# EasyEDA Pro project 立创·天猛星MSPM0G3507开发板.eprj, board PCB
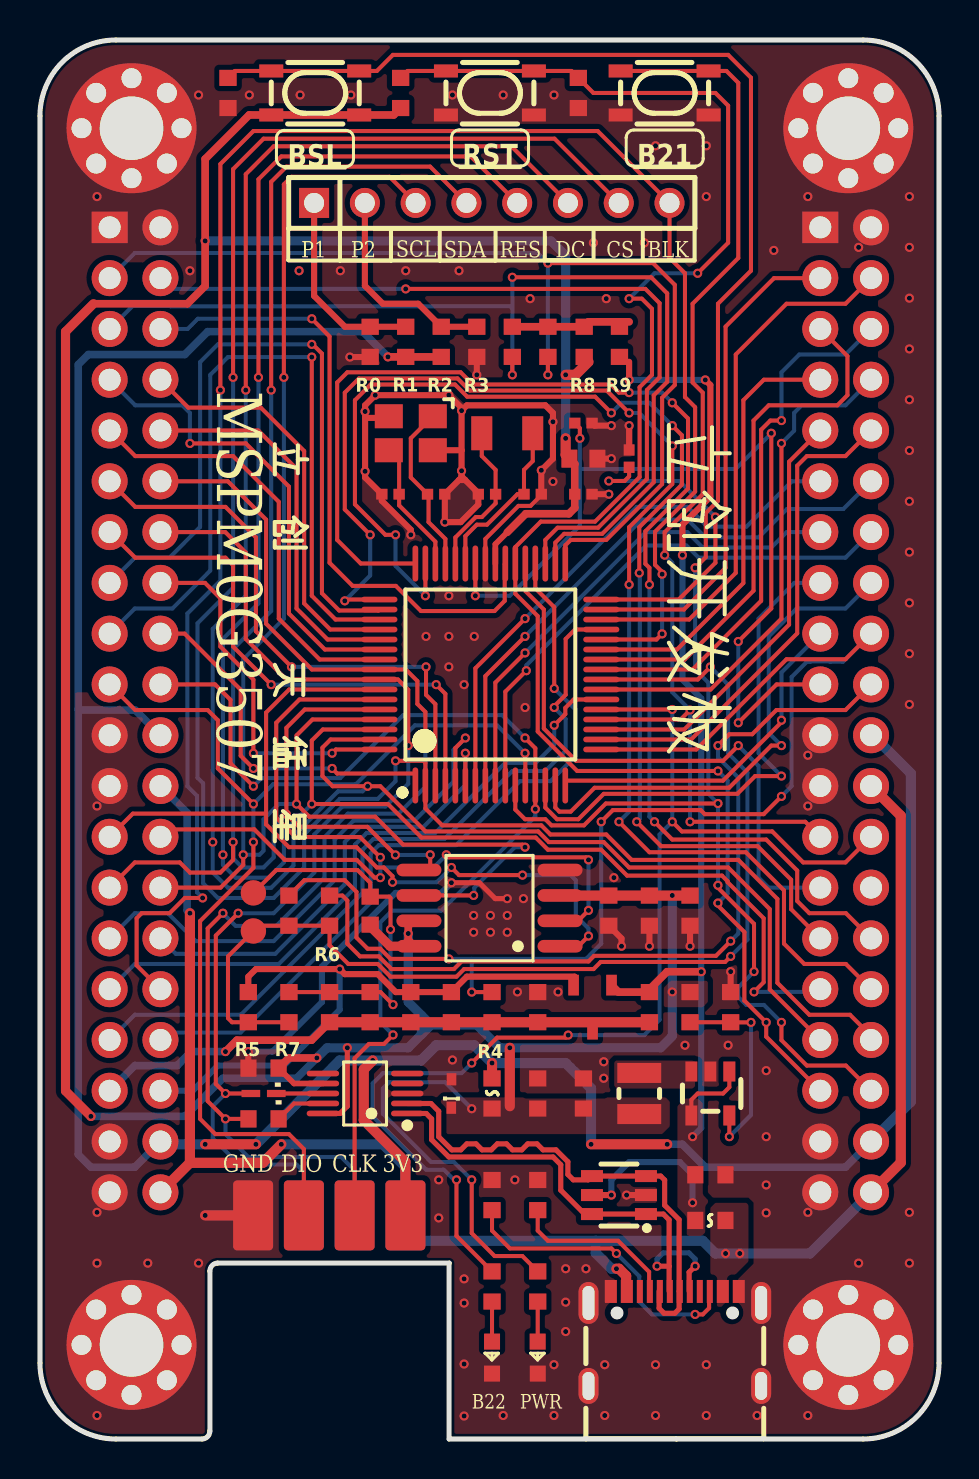
[diagram p3: board, top side]
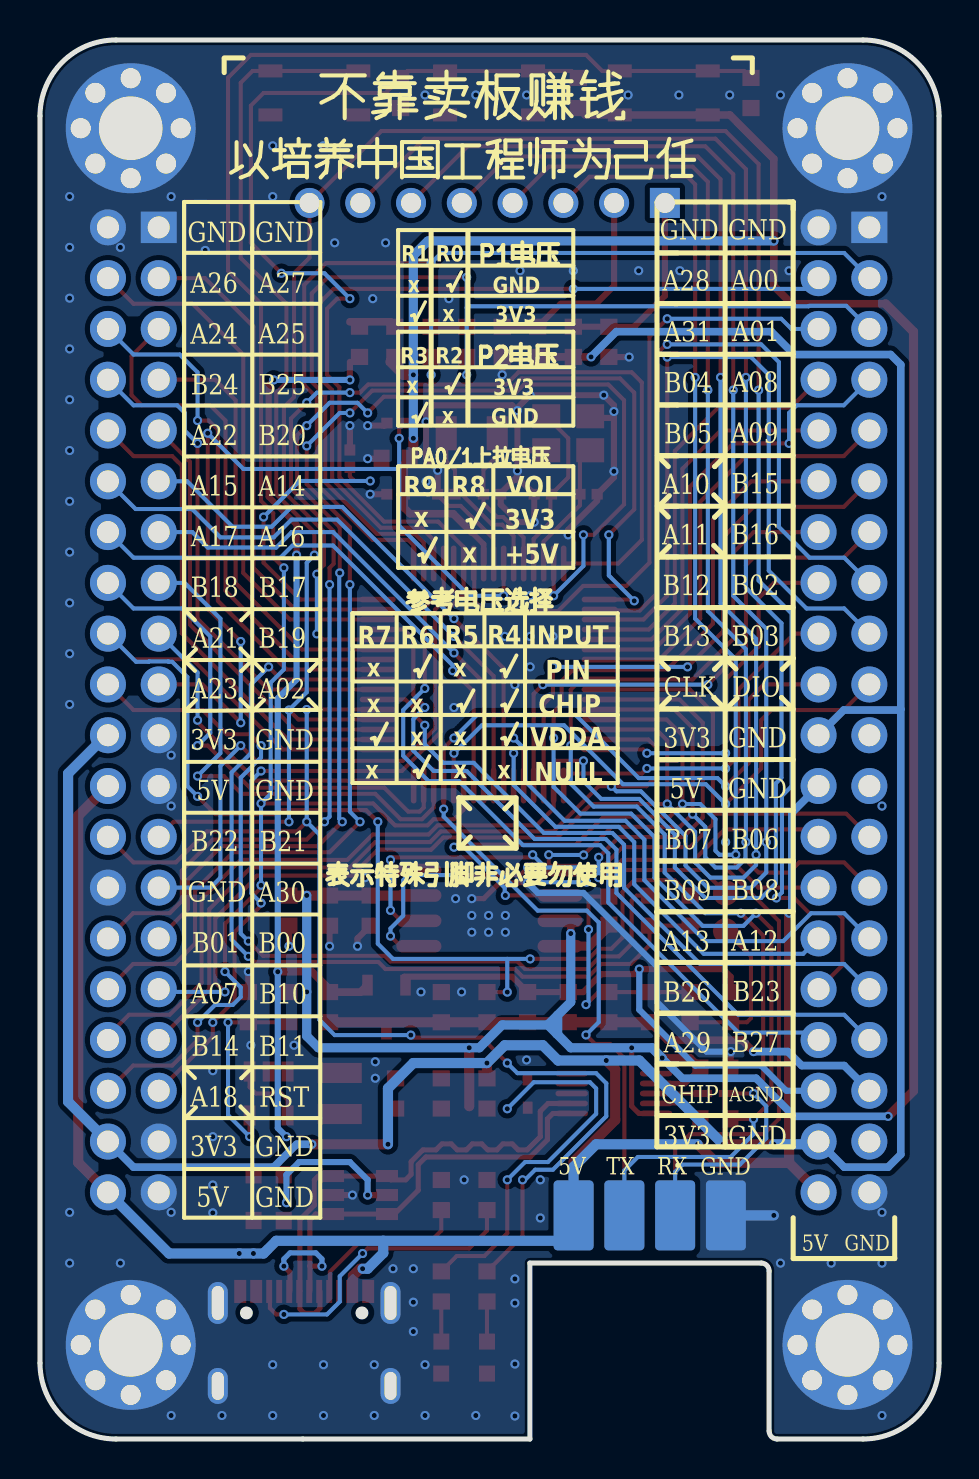
[diagram p4: board, bottom side, seen from below]

Outline 44.97 x 69.97 mm; copper layers: Top Layer, Bottom Layer. Coordinates in mm from the lower left corner of the outline.
Outline path: 0,66.17 arc(1.11,68.85) 3.8,69.97 41.18,69.97 arc(43.86,68.85) 44.97,66.17 44.97,3.8 arc(43.86,1.11) 41.18,0 20.47,0 20.47,8.8 8.9,8.8 arc(8.62,8.68) 8.5,8.4 8.5,0.4 arc(8.38,0.12) 8.1,0 3.8,0 arc(1.11,1.11) 0,3.8 0,66.17
Stack: Top Layer 0.035mm / Dielectric1 1.51mm FR4 er 4.5 / Bottom Layer 0.035mm

## Design rules (mm)
net USB_D-: DP2
net USB_D+: DP2
template: 自定义配置
spacing copperThickness1oz (default): track to track 0.102, other pairs 0.152 to 0.3
spacing copperThickness2oz: track to track 0.203, other pairs 0.152 to 0.3
track width copperThickness1oz (default): min 0.203, default 0.203, max 2.54
track width copperThickness2oz: min 0.203, default 0.305, max 2.54
differential pair differentialPair (default): width min 0.254, default 0.254, max 0.254; gap min 0.102, default 0.102
via viaSize (default): diameter min 0.457, default 0.457, max 10; hole min 0.254, default 0.254, max 6.299
net GND uses copperThickness2oz

## Placement (name value [footprint] x y rotation side)
BSL  K2-1808SN-A4SW-01  [KEY-SMD_4P-L4.2-W3.2-P2.20-LS5.1-TL]  13.77 67.32 0 top
C10  1uF  [R0603]  14.49 21.6 90 top
C11  100nF  [R0603]  16.52 21.6 90 top
C27  22uF  [R0603]  33.54 13.22 0 top
C28  22uF  [R0603]  27.19 17.28 90 top
C29  100nF  [R0603]  24.9 17.28 90 top
C33  10nF  [R0603]  26.93 67.32 90 top
C34  15pF  [R0402]  19.82 47.25 0 top
C35  15pF  [R0402]  17.53 47.25 0 top
C36  12pF  [R0402]  24.65 47.25 180 top
C37  12pF  [R0402]  22.36 47.25 0 top
C38  100nF  [R0402]  27.19 47.25 180 top
C39  10uF  [C0603]  27.19 49.03 180 top
C40  470nF  [R0402]  29.47 49.03 90 top
C44  1uF  [R0603]  12.45 26.42 270 top
C46  100nF  [R0603]  28.46 26.42 90 top
C47  100nF  [R0603]  11.18 18.55 0 top
C48  470nF  [R0603]  30.49 21.6 90 top
C49  1uF  [R0603]  18.55 21.6 90 top
C50  100nF  [R0603]  20.58 21.6 90 top
C51  100nF  [R0603]  32.52 26.42 90 top
C52  1uF  [R0603]  30.49 26.42 90 top
D1  BST236A054U  [SOT-23-6_L2.9-W1.6-P0.95-LS2.8-BR]  28.96 12.2 0 top
D6  LESD5Z3.3T1G  [SOD-523F_L1.2-W0.8-LS1.7-RD]  20.58 17.28 90 top
D9  RB521S30T1G  [SOD-523_L1.2-W0.8-LS1.6-RD]  11.18 17.28 180 top
F1  BSMD0603-050-6V  [F0603]  33.54 10.93 180 top
F2  BSMD0603-050-6V  [F0603]  22.61 17.28 90 top
H8  -  [HDR-TH_8P-P2.54-V-M]  22.6 61.82 0 top
hole1  M3  [m3 125x300]  40.44 4.71 0 top
hole2  M3  [m3 125x300]  4.58 4.71 0 top
hole3  M3  [m3 125x300]  4.58 65.55 0 top
hole4  M3  [m3 125x300]  40.44 65.55 0 top
KEY  K2-1808SN-A4SW-01  [KEY-SMD_4P-L4.2-W3.2-P2.20-LS5.1-TL]  31.25 67.32 0 top
L1  2.2uH  [ind-smd_l2.5-w2.0_tfm252012alma2r2mtaa]  29.98 17.28 90 top
L2  GZ1608D601TF  [L0603]  16.52 26.42 90 top
LINK1  NCD0603G1  [LED0603-RD]  22.61 4.07 90 top
PWR1  NCD0603R1  [LED0603-RD_RED]  24.9 4.07 90 top
R0  0Ω  [R0603]  16.52 54.87 270 top
R1  NC  [R0603]  18.3 54.87 90 top
R2  0Ω  [R0603]  20.07 54.87 270 top
R3  NC  [R0603]  21.85 54.87 90 top
R4  NC  [R0603]  22.61 21.6 270 top
R5  NC  [R0603]  10.42 21.6 90 top
R6  0Ω  [R0603]  14.49 26.42 90 top
R7  NC  [R0603]  12.45 21.6 90 top
R8  0Ω  [R0603]  27.23 54.87 90 top
R9  NC  [R0603]  28.99 54.87 90 top
R14  22kΩ  [R0603]  34.55 21.6 90 top
R15  100kΩ  [R0603]  32.52 21.6 270 top
R18  100kΩ  [R0402]  27.19 50.81 0 top
R19  2kΩ  [R0603]  22.61 7.63 270 top
R20  4.7kΩ  [R0603]  23.63 54.87 90 top
R21  4.7kΩ  [R0603]  25.41 54.87 90 top
R24  47kΩ  [R0603]  18.04 67.32 270 top
R25  47kΩ  [R0603]  9.41 67.32 90 top
R27  5.1kΩ  [R0603]  22.61 12.2 90 top
R28  5.1kΩ  [R0603]  24.9 12.2 90 top
R29  2kΩ  [R0603]  24.9 7.63 270 top
R37  200Ω  [R0603]  11.18 16.01 180 top
R42  0Ω  [R0603]  24.9 21.6 90 top
RESET  K2-1808SN-A4SW-01  [KEY-SMD_4P-L4.2-W3.2-P2.20-LS5.1-TL]  22.51 67.32 0 top
TP2  -  [Test-Point-1.27mm]  10.68 27.31 180 top
TP4  -  [Test-Point-1.27mm]  10.68 25.41 180 top
U1  -  [LQFP-64_L10.0-W10.0-P0.50-LS12.0-TL]  22.53 38.23 90 top
U9  -  [sot-23-5_l2.9-w1.6-p0.95-ls2.8-bl]  33.54 17.28 180 top
U18  CH340E  [MSOP-10_L3.0-W3.0-P0.50-LS5.0-BL]  16.26 17.28 90 top
U20  2541WV-2x04P  [HDR-TH_8P-P2.54-V-M-R2-C4-S2.54-3]  14.47 11.18 0 top
U21  PZ2.54-2*20  [HDR-TH_40P-P2.54-V-M-R2-C20-S2.54]  4.76 36.47 270 top
U22  PZ2.54-2*20  [HDR-TH_40P-P2.54-V-M-R2-C20-S2.54]  40.31 36.47 270 top
U23  REF3033AIDBZR  [SOT-23-3_L3.0-W1.7-P0.95-LS2.9-BR]  27.64 21.6 90 top
U24  W25Q128JVSIQ  [SOIC-8_L5.3-W5.3-P1.27-LS8.0-BL]  22.49 26.55 90 top
USB1  TYPE-C16PIN  [USB-C-SMD_TYPE-C16PIN]  31.76 5.02 0 top
X1  40MHz  [OSC-SMD_4P-L3.2-W2.5-BL_SIT8008BI]  18.55 50.3 180 top
X3  32.768kHz  [OSC-SMD_L3.2-W1.5]  23.38 50.3 180 top

## Footprints (pads in the part's own frame, mm; a bottom-side part is the same pattern mirrored in y, then rotated)
C0603
  rect 0.8x0.9 smd: 1(-0.7,0) 2(0.7,0)
F0603
  rect 0.806x0.864 smd: 1(-0.753,0) 2(0.753,0)
HDR-TH_8P-P2.54-V-M
  rect 1.5x1.5 hole 1: 1(-8.89,0)
  round 1.5 hole 1: 2(-6.35,0) 3(-3.81,0) 4(-1.27,0) 5(1.27,0) 6(3.81,0) 7(6.35,0) 8(8.89,0)
HDR-TH_8P-P2.54-V-M-R2-C4-S2.54-3
  rrect 2x3.5 smd far side: 1(3.81,0) 3(1.27,0) 5(-1.27,0) 7(-3.81,0)
  rrect 2x3.5 smd: 2(3.81,0) 4(1.27,0) 6(-1.27,0) 8(-3.81,0)
HDR-TH_40P-P2.54-V-M-R2-C20-S2.54
  rect 1.575x1.8 hole 1.1: 1(-24.13,-1.27)
  round 1.8 hole 1.1: 2(-24.13,1.27) 3(-21.59,-1.27) 4(-21.59,1.27) 5(-19.05,-1.27) 6(-19.05,1.27) 7(-16.51,-1.27) 8(-16.51,1.27) 9(-13.97,-1.27) 10(-13.97,1.27) 11(-11.43,-1.27) 12(-11.43,1.27) 13(-8.89,-1.27) 14(-8.89,1.27) 15(-6.35,-1.27) 16(-6.35,1.27) 17(-3.81,-1.27) 18(-3.81,1.27) 19(-1.27,-1.27) 20(-1.27,1.27) 21(1.27,-1.27) 22(1.27,1.27) 23(3.81,-1.27) 24(3.81,1.27) 25(6.35,-1.27) 26(6.35,1.27) 27(8.89,-1.27) 28(8.89,1.27) 29(11.43,-1.27) 30(11.43,1.27) 31(13.97,-1.27) 32(13.97,1.27) 33(16.51,-1.27) 34(16.51,1.27) 35(19.05,-1.27) 36(19.05,1.27) 37(21.59,-1.27) 38(21.59,1.27) 39(24.13,-1.27) 40(24.13,1.27)
ind-smd_l2.5-w2.0_tfm252012alma2r2mtaa
  rect 1x2.2 smd: 1(1.028,0) 2(-1.028,0)
KEY-SMD_4P-L4.2-W3.2-P2.20-LS5.1-TL
  rect 1.2x0.65 smd: 1(-2.2,1.1) 2(2.2,1.1) 3(-2.2,-1.1) 4(2.2,-1.1)
L0603
  rect 0.8x0.864 smd: 1(-0.7,0) 2(0.7,0)
LED0603-RD
  rect 0.8x0.8 smd: 1(-0.799,0) 2(0.799,0)
LED0603-RD_RED
  rect 0.8x0.8 smd: 1(-0.799,-0.004) 2(0.799,0.004)
LQFP-64_L10.0-W10.0-P0.50-LS12.0-TL
  oval 1.8x0.28 smd: 1(-5.55,3.75) 2(-5.55,3.25) 3(-5.55,2.75) 4(-5.55,2.25) 5(-5.55,1.75) 6(-5.55,1.25) 7(-5.55,0.75) 8(-5.55,0.25) 9(-5.55,-0.25) 10(-5.55,-0.75) 11(-5.55,-1.25) 12(-5.55,-1.75) 13(-5.55,-2.25) 14(-5.55,-2.75) 15(-5.55,-3.25) 16(-5.55,-3.75) 33(5.55,-3.75) 34(5.55,-3.25) 35(5.55,-2.75) 36(5.55,-2.25) 37(5.55,-1.75) 38(5.55,-1.25) 39(5.55,-0.75) 40(5.55,-0.25) 41(5.55,0.25) 42(5.55,0.75) 43(5.55,1.25) 44(5.55,1.75) 45(5.55,2.25) 46(5.55,2.75) 47(5.55,3.25) 48(5.55,3.75)
  oval 0.28x1.8 smd: 17(-3.75,-5.55) 18(-3.25,-5.55) 19(-2.75,-5.55) 20(-2.25,-5.55) 21(-1.75,-5.55) 22(-1.25,-5.55) 23(-0.75,-5.55) 24(-0.25,-5.55) 25(0.25,-5.55) 26(0.75,-5.55) 27(1.25,-5.55) 28(1.75,-5.55) 29(2.25,-5.55) 30(2.75,-5.55) 31(3.25,-5.55) 32(3.75,-5.55) 49(3.75,5.55) 50(3.25,5.55) 51(2.75,5.55) 52(2.25,5.55) 53(1.75,5.55) 54(1.25,5.55) 55(0.75,5.55) 56(0.25,5.55) 57(-0.25,5.55) 58(-0.75,5.55) 59(-1.25,5.55) 60(-1.75,5.55) 61(-2.25,5.55) 62(-2.75,5.55) 63(-3.25,5.55) 64(-3.75,5.55)
m3 125x300
  round 1 hole 1: 1(-2.5,0) 1(-1.768,1.768) 1(-1.768,-1.768) 1(0,2.5) 1(0,-2.5) 1(1.768,1.768) 1(2.5,0)
  round 6.5 hole 3.18x3.175: 1(0,0)
  round 1 hole 1.021x1: 1(1.768,-1.768)
MSOP-10_L3.0-W3.0-P0.50-LS5.0-BL
  oval 0.28x1.62 smd: 1(-1,-2.11) 2(-0.5,-2.11) 3(0,-2.11) 4(0.5,-2.11) 5(1,-2.11) 6(1,2.11) 7(0.5,2.11) 8(0,2.11) 9(-0.5,2.11) 10(-1,2.11)
OSC-SMD_4P-L3.2-W2.5-BL_SIT8008BI
  rect 1.4x1.2 smd: 1(-1.1,-0.85) 2(1.1,-0.85) 3(1.1,0.85) 4(-1.1,0.85)
OSC-SMD_L3.2-W1.5
  rect 1.05x1.7 smd: 1(-1.275,0) 2(1.275,0)
R0402
  rect 0.566x0.54 smd: 1(-0.433,0) 2(0.433,0)
R0603
  rect 0.806x0.864 smd: 1(-0.753,0) 2(0.753,0)
SOD-523_L1.2-W0.8-LS1.6-RD
  rect 0.93x0.36 smd: 1(-0.635,0) 2(0.635,0)
SOD-523F_L1.2-W0.8-LS1.7-RD
  custom 0.609x0.483 smd: 1(-0.711,0.005) 2(0.711,-0.005)
SOIC-8_L5.3-W5.3-P1.27-LS8.0-BL
  oval 0.63x2.25 smd: 1(-1.905,-3.53) 2(-0.635,-3.53) 3(0.635,-3.53) 4(1.905,-3.53) 5(1.905,3.53) 6(0.635,3.53) 7(-0.635,3.53) 8(-1.905,3.53)
SOT-23-3_L3.0-W1.7-P0.95-LS2.9-BR
  rect 1.038x0.532 smd: 1(1.101,-0.95) 2(1.101,0.95) 3(-1.101,0)
sot-23-5_l2.9-w1.6-p0.95-ls2.8-bl
  rect 0.6x1.001 smd: 1(-0.95,-1.1) 2(0,-1.1) 3(0.95,-1.1) 4(0.95,1.1) 5(-0.95,1.1)
SOT-23-6_L2.9-W1.6-P0.95-LS2.8-BR
  rect 1.1x0.6 smd: 1(1.35,-0.95) 2(1.35,0) 3(1.35,0.95) 4(-1.35,0.95) 5(-1.35,0) 6(-1.35,-0.95)
Test-Point-1.27mm
  round 1.27 smd: 1(0,0)
USB-C-SMD_TYPE-C16PIN
  oval 1x2.1 hole 0.6x1.7: 1(-4.32,1.788) 2(4.32,1.788)
  oval 1x1.8 hole 0.6x1.4: 3(-4.32,-2.362) 4(4.32,-2.362)
  rect 0.6x1.15 smd: A1B12(-3.2,2.362) A4B9(-2.4,2.362) B1A12(3.2,2.362) B4A9(2.4,2.362)
  rect 0.3x1.15 smd: A5(-1.25,2.362) A6(-0.25,2.362) A7(0.25,2.362) A8(-1.75,2.362) B5(1.75,2.362) B6(0.75,2.362) B7(-0.75,2.362) B8(1.25,2.362)

## Nets
As in the schematic, except:
3V3: BSL.3 BSL.4 C28.1 C29.1 C38.2 C39.2 C46.2 C47.2 C51.2 C52.2 D6.1 F2.1 L1.2 L2.1 R8.1 R15.1 R24.2 R29.1 U1.40 U18.7 U18.10 U24.3 U24.7 U24.8
GND: C27.2 C28.2 C29.2 C33.1 C34.2 C35.1 C36.1 C37.1 C38.1 C39.1 C40.2 C46.1 C47.1 C51.1 C52.1 D1.2 D6.2 hole1.1 hole2.1 hole3.1 hole4.1 KEY.3 KEY.4 LINK1.1 PWR1.1 R0.2 R3.1 R14.2 R18.2 R25.1 R27.2 R28.2 R42.2 RESET.3 RESET.4 U1.41 U9.2 U18.3 U20.7 U20.8 U21.1 U21.2 U21.21 U21.23 U21.37 U21.39 U22.1 U22.2 U22.21 U22.23 U22.28 U22.37 U22.39 U24.4 USB1.1 USB1.2 USB1.3 USB1.4 USB1.A1B12 USB1.B1A12 X1.2 X1.4

Pads without a net: U18 4 5 6; USB1 A8 B8

## Via types
v1: diameter 0.457, hole 0.254, Top Layer to Bottom Layer, 287 vias

## Routing (per net, layer and track width the routed paths; a pad name or vN(x,y) marks a point on that pad's centre or on a via; arc(x,y) is an arc through that point)
3V3: length 191.5
  Top Layer w0.203: R29.1 24.13,9.15 22.74,9.15 21.6,10.29 v1(21.6,12.96)
  Top Layer w0.254: v1(15.38,19.57) 15.38,16.64 15.01,16.28 U18.10
  Top Layer w0.28: U1.40 22.78,44.75 23.38,45.35 ; C47.2 12.71,17.78 U18.7
  Top Layer w0.381: v1(13.85,19.06) 12.45,19.06 C47.2 ; 18.42,24.9 v1(18.42,25.28) 18.42,25.66 18.69,25.93 19.52,25.93 ; 23.38,45.35 24.3,46.27 26.46,46.27 26.75,46.56 C38.2 26.75,48.76 C39.2 ; R24.2 17.7,66.22 BSL.3 10.47,66.22 8.26,64.02 v1(8.26,59.92) 8.26,57.67 7.37,56.78 2.68,56.78
  Top Layer w0.457: 2.68,56.78 1.28,55.38 1.28,17.41 v1(2.55,16.14) ; L2.1 16.52,25.64 17.51,24.65 U24.8 19.52,24.65 ; 18.42,24.9 18.66,24.66
  Top Layer w0.508: C39.2 26.3,49.22 v1(26.3,50.05) ; C51.2 C52.2 C46.2 25.57,27.18 25.55,27.2 ; 27.44,53.87 26.79,53.22 v1(26.3,53.22) ; 23.5,16.64 v1(23.5,19.57)
  Bottom Layer w0.203: v1(21.6,16.52) 20.27,17.84 17.46,17.84 17.15,17.53 17.15,16.26 19.57,13.85 20.71,13.85 v1(21.6,12.96)
  Bottom Layer w0.381: v1(2.55,16.14) 7.25,16.14 9.15,18.04 12.84,18.04 v1(13.85,19.06)
  Bottom Layer w0.457: 19.08,21.19 18.42,21.85 v1(18.42,25.28) ; 19.08,21.19 19.08,20.3 19.12,20.26 ; 19.08,21.19 19.57,20.71 ; v1(31.63,27.19) v1(31.63,22.36) 31.63,20.15 31.05,19.57 v1(23.5,19.57) 23,19.57 21.85,20.71 19.57,20.71 ; v1(8.26,59.92) 25.57,59.92 26.3,59.19 v1(26.3,53.22) v1(26.3,50.05) ; 19.12,20.26 18.42,19.57 v1(15.38,19.57) 14.36,19.57 v1(13.85,19.06) ; 19.12,20.26 19.57,20.71
+5V: length 60.5
  Top Layer w0.203: U9.1 34.49,17.59 34.17,17.28 32.9,17.28 32.59,16.96 U9.4
  Top Layer w0.305: v1(33.28,52.97) 33.54,52.71 33.54,47.12 32.14,45.73 v1(32.14,44.2) ; 29.47,53.87 v1(29.47,52.97) ; D1.5 v1(28.58,12.2)
  Top Layer w0.381: U23.1 28.94,22.35 C48.2 30.49,22.49 31.37,23.37 v1(33.08,23.37)
  Bottom Layer w0.305: v1(32.65,11.82) 32.65,13.22 32.01,13.85 29.47,13.85 28.58,12.96 v1(28.58,12.2) ; v1(32.14,44.2) 32.14,37.98 33.08,37.04 v1(33.08,23.37) 33.08,15.55 v1(32.65,15.12) ; v1(29.47,52.97) v1(33.28,52.97)
AGND: length 28.4
  Top Layer w0.381: v1(9.28,19.38) 9.85,19.95 13.59,19.95 C10.1
  Top Layer w0.508: C48.1 R42.1 R4.2 C50.1 C49.1 C11.1 C10.1
  Bottom Layer w0.381: U21.35 4.75,18.68 6.87,18.68 7.56,19.38 v1(9.28,19.38)
GND: length 75.3
  Top Layer w0.203: C36.1 25.08,47.2 24.54,46.67 23.94,46.67 22.28,45.01 U1.41
  Top Layer w0.254: v1(23.38,27.02) 22.78,27.02 21.98,27.82 v1(20.58,27.82)
  Top Layer w0.305: R14.2 v1(34.55,23.38) ; C52.1 v1(30.49,24.65) ; 16.26,51.07 17.37,51.07 X1.2 ; 16.26,51.07 v1(16.26,51.39) 16.26,51.7 v1(16.77,52.2) v1(20.46,52.2) 21.09,51.57 v1(21.09,51.43) ; 16.26,51.07 v1(16.26,48.4) 16.26,48.09 17.1,47.25 17.1,46.92 18.55,45.47 v1(18.55,45.22) ; 21.27,47.96 20.96,47.96 ; 21.27,47.96 21.93,47.3 C37.1 21.93,46.74 21.05,45.85 v1(20.25,45.85) C34.2 20.96,47.96 ; 21.27,47.96 21.09,48.14 ; 20.96,47.96 21.09,48.09 21.09,48.14 ; R18.2 27.75,50.68 v1(28.58,50.68) ; X1.4 21.08,49.45 21.09,49.44 ; C38.1 v1(28.46,47.25) ; C39.1 v1(28.58,49.03) ; v1(21.09,51.43) 21.36,51.7 25.28,51.7 25.66,51.32 v1(25.66,50.87) 25.66,49.03 v1(25.08,48.45) C36.1 ; v1(21.09,51.43) 21.09,49.44 ; R3.1 v1(21.85,53.22) ; 21.09,49.44 v1(21.09,48.42) 21.09,48.14 ; 25.55,28.47 26.68,28.47 ; C51.1 v1(32.52,24.65) ; v1(29.09,24.65) 29.09,25.03 C46.1 ; C47.1 10.42,18.56 v1(10.42,19.38) ; C40.2 v1(29.47,50.68) ; v1(15.5,54.11) 16.51,54.11 R0.2 ; D1.2 v1(29.35,12.2)
  Top Layer w0.508: U20.7 v1(8.26,11.18)
  Bottom Layer w0.305: v1(10.42,19.38) 11.63,19.38 14.11,21.85 14.11,23.63 17.79,27.31 20.07,27.31 v1(20.58,27.82)
  Bottom Layer w0.508: U20.7 v1(8.26,11.18)
  vias: v1(2.85,62.14) v1(2.85,31.66) v1(2.85,11.34) v1(2.85,8.8) v1(2.85,1.18) v1(5.39,8.8) v1(7.5,58.43) v1(7.93,67.22) v1(7.93,8.8) v1(10.47,67.22) v1(13.01,67.22) v1(12.96,58.43) v1(15.03,58.43) v1(15.55,67.22) v1(18.3,58.43) v1(19.31,40.14) v1(19.95,12.96) v1(19.95,11.06) v1(20.46,42.17) v1(20.46,40.14) v1(20.46,38.62) v1(20.63,67.22) v1(20.63,18.96) v1(20.96,58.43) v1(21.22,37.73) v1(21.22,8.01) v1(21.22,6.8) v1(21.22,3.75) v1(21.22,1.15) v1(21.73,40.14) v1(21.69,26.18) v1(21.69,25.34) v1(22.53,26.18) v1(22.53,25.34) v1(23.17,67.22) v1(23.17,1.18) v1(23.38,26.18) v1(23.38,25.34) v1(23.76,12.96) v1(23.88,22.36) v1(24.19,27.02) v1(24.27,36.58) v1(24.52,57.03) v1(25.71,67.22) v1(25.66,47.89) v1(25.71,3.72) v1(25.71,1.18) v1(25.92,22.36) v1(26.3,8.52) v1(26.3,6.84) v1(26.3,5.37) v1(27.31,8.52) v1(27.69,59.82) v1(28.2,18.87) v1(28.2,18.04) v1(28.25,3.72) v1(28.25,1.18) v1(28.33,57.03) v1(28.71,28.07) v1(30.23,59.82) v1(30.79,64.68) v1(30.79,3.72) v1(30.79,1.18) v1(32.27,19.69) v1(33.33,64.68) v1(33.33,62.14) v1(33.33,3.72) v1(33.33,1.18) v1(34.43,19.69) v1(35.87,1.18) v1(36.33,18.42) v1(36.33,15.12) v1(36.33,12.7) v1(36.33,11.31) v1(36.71,59.44) v1(38.41,62.14) v1(38.41,34.2) v1(38.41,31.66) v1(38.41,11.34) v1(38.41,1.18) v1(40.95,59.6) v1(40.95,8.8) v1(43.49,62.14) v1(43.49,59.6) v1(43.49,57.06) v1(43.49,54.52) v1(43.49,51.98) v1(43.49,49.44) v1(43.49,46.9) v1(43.49,44.36) v1(43.49,41.82) v1(43.49,39.28) v1(43.49,36.74) v1(43.49,11.34) v1(43.49,8.8)
VBUS_5V: length 86.5
  Top Layer w0.508: 7.5,13.81 v1(7.5,26.3) ; 7.5,13.81 11.15,13.81 v1(12.07,14.74) ; 7.5,13.81 6.03,12.34 ; U22.24 43.06,31.17 43.06,13.82 41.58,12.34 ; 29.32,7.4 29.32,8.16 28.96,8.52 v1(28.84,8.52)
  Bottom Layer w0.381: U21.24 7.36,31.32 7.36,26.44 v1(7.5,26.3)
  Bottom Layer w0.508: 27.8,9.91 18.42,9.91 18.28,10.06 U20.1 18.28,13.61 17.15,14.74 v1(12.07,14.74) ; 27.8,9.91 27.8,9.3 28.58,8.52 v1(28.84,8.52) ; 27.8,9.91 33.16,9.91 33.79,9.28 v1(34.3,9.28) v1(35.01,9.28) 38.52,9.28 41.58,12.34
340_RX: length 2.5
  Top Layer w0.203: U18.9 12.71,16.78 R37.1
340_TX: length 2.3
  Top Layer w0.203: U18.8 11.82,17.28
BLK: length 96.3
  Top Layer w0.203: U21.32 4.83,23.69 4.83,26.04 5.09,26.3 6.49,26.3 7.25,27.06 v1(8.14,27.06) ; v1(9.03,52.46) 9.03,63.76 10.68,65.41 27.9,65.41 H8.8 31.49,59.07 32.27,58.3 32.27,52.11 32.77,51.6 32.77,47.38 30.77,45.37 30.77,43.72 31.12,43.36 v1(31.12,43.25) ; v1(31.12,40.27) 30.84,39.98 U1.28
  Bottom Layer w0.203: v1(8.14,27.06) 7.86,27.34 7.86,32.16 7.37,32.65 7.37,41.28 9.03,42.93 v1(9.03,52.46) ; v1(31.12,43.25) v1(31.12,40.27)
BSLRX: length 56.1
  Top Layer w0.203: U21.14 9.27,45.36 10.3,44.33 10.3,40.01 12.32,37.98 U1.57 17.91,37.98 18.42,37.47 v1(18.42,34.68) ; v1(9.91,26.3) 8.8,25.18 8.8,17.76 v1(9.28,17.28) D9.2
  Bottom Layer w0.203: v1(9.91,26.3) 11.69,26.3 13.72,28.33 13.72,30.23 15.12,31.63 17.28,31.63 18.42,32.77 v1(18.42,34.68) ; v1(9.28,17.28) 8.64,16.64 8.64,15.04 9.96,13.72 12.84,13.72 13.2,13.36 U20.5
BSLTX: length 62.3
  Top Layer w0.203: v1(9.15,26.3) 8.39,25.53 8.39,16.9 v1(9.28,16.01) R37.2 ; v1(19.28,35.06) 19.28,36.36 18.88,36.76 18.88,37.9 18.3,38.48 U1.56 13.6,38.48 11.31,40.77 11.31,45.98 9.4,47.9 6.03,47.9
  Bottom Layer w0.203: v1(19.28,35.06) 19.28,32.61 17.94,31.27 15.4,31.27 14.23,30.11 14.23,28.07 11.82,25.66 9.79,25.66 v1(9.15,26.3) ; U20.3 15.74,13.43 15.06,14.1 10.42,14.1 9.28,15.25 v1(9.28,16.01)
EXT_3V3: length 142.4
  Top Layer w0.381: R2.2 R1.1 v1(17.41,54.12)
  Top Layer w0.508: F2.2 v1(22.61,18.8) ; v1(10.8,14.74) v1(8.26,14.74) ; U20.2 18.28,13.87 16.2,15.95 16.2,18.48 v1(16.65,18.93) ; v1(31.38,14.74) v1(27.57,14.74)
  Bottom Layer w0.381: 1.91,36.49 1.91,53.73 2.42,54.24 7.25,54.24 8.39,55.38 16.15,55.38 v1(17.41,54.12) ; 1.91,36.49 1.95,36.46 4.77,36.46 U21.22 ; 1.91,36.49 1.91,14.23 2.55,13.6 4.75,13.6 U21.38 ; U22.38 40.3,13.6 33.28,13.6 32.14,14.74 v1(31.38,14.74)
  Bottom Layer w0.508: v1(27.57,14.74) 27.57,17.53 26.3,18.8 v1(22.61,18.8) 21.73,19.69 19.82,19.69 19.06,18.93 v1(16.65,18.93) 14.99,18.93 v1(10.8,14.74) ; U21.38 6.16,14.74 v1(8.26,14.74) ; U22.22 41.65,35.2 43.57,33.28 43.57,16.87 U22.38
EXT_CHIP_VREF+: length 31.1
  Top Layer w0.305: 26.74,22.7 26.74,23.12 21.35,23.12 C50.2 C49.2 17.8,22.35 16.9,23.25 15.25,23.25 v1(14.99,23.5) 10.8,23.5 10.42,23.12 R5.2
  Bottom Layer w0.305: v1(14.99,23.5) 14.99,21.47 12.2,18.68 8.9,18.68 7.64,17.42 U21.36
EXT_PIN_VREF+: length 42.7
  Top Layer w0.203: R6.2 15.13,27.18 15.38,26.93 15.38,24.77 16.01,24.14 16.95,24.14 17.58,23.5 20.71,23.5 21.09,23.88 27.44,23.88 27.72,24.16 33.82,24.16 v1(34.55,24.9) ; U22.20 40.3,36.46 36.84,36.46 35.63,35.25 34.48,35.25 v1(33.92,34.68)
  Bottom Layer w0.203: v1(33.92,34.68) 33.92,34.09 34.93,33.07 34.93,25.28 v1(34.55,24.9)
LCD_CS: length 105.6
  Top Layer w0.203: v1(17.79,33.92) 19.19,33.92 19.28,33.82 U1.2 19.28,31.54 20.13,30.69 25.08,30.69 25.54,30.23 28.33,30.23 29.6,28.96 34.93,28.96 36.89,27.01 36.89,22.82 38.49,21.22 40.52,21.22 41.58,20.16 U22.34 ; v1(9.66,53.09) 9.66,63.51 11.18,65.03 25.74,65.03 H8.7
  Bottom Layer w0.203: v1(17.79,33.92) 17.79,32.9 16.9,32.01 14.99,32.01 13.22,30.23 13.22,28.58 11.69,27.06 8.9,27.06 8.16,27.79 8.16,32.79 7.88,33.07 7.88,40.8 9.66,42.58 v1(9.66,53.09)
LCD_DC: length 101.7
  Top Layer w0.203: v1(10.3,52.46) 10.3,63.25 11.69,64.65 23.58,64.65 H8.6 ; U1.63 14.54,34.98 14.13,34.58 14.13,33.15 14.64,32.65 v1(16.39,32.65) 17.03,32.65 19.29,30.39 24.93,30.39 25.46,29.85 28.2,29.85 29.47,28.58 34.43,28.58 36.51,26.5 36.51,22.48 U22.33
  Bottom Layer w0.203: v1(16.39,32.65) 16.14,32.39 14.91,32.39 12.68,30.16 12.68,28.68 11.57,27.57 9.41,27.57 8.64,28.33 v1(8.64,29.85) 8.64,40.52 10.3,42.17 v1(10.3,52.46)
LCD_RES: length 95.6
  Top Layer w0.203: v1(10.93,53.09) 10.93,63 12.07,64.14 21.55,64.14 H8.5 ; U1.62 14.15,35.48 13.6,34.93 v1(13.6,31.76) 17.41,31.76 19.08,30.08 24.8,30.08 25.41,29.47 28.08,29.47 29.37,28.18 34.12,28.18 34.4,27.89 34.4,27.85 36.2,26.04 36.2,22.84 v1(35.72,22.36)
  Bottom Layer w0.203: v1(13.6,31.76) 12.2,30.36 12.2,28.84 11.44,28.07 9.79,28.07 9.15,28.71 v1(9.15,29.22) 9.15,40.01 10.93,41.79 v1(10.93,53.09) ; v1(35.72,22.36) 38.9,22.36 U22.31
LCD_SCL: length 78.2
  Top Layer w0.203: U21.28 9.04,27.58 10.17,28.71 v1(10.17,29.22) ; U1.61 13.63,35.98 12.84,35.19 v1(12.84,31.76) 13.47,31.12 16.77,31.12 18.17,29.73 24.14,29.73 v1(24.27,29.6) ; H8.3 17.49,63.13 12.58,63.13 12.2,62.75 v1(12.2,53.09) ; U24.6 v1(21.69,27.19)
  Bottom Layer w0.203: v1(12.84,31.76) 11.95,31.76 11.18,31 11.18,29.42 10.98,29.22 v1(10.17,29.22) 10.17,39 12.2,41.03 v1(12.2,53.09) ; 21.73,27.19 21.73,27.57 23.76,29.6 v1(24.27,29.6)
LCD_SDA: length 76.5
  Top Layer w0.203: H8.4 19.52,63.63 12.33,63.63 11.57,62.87 v1(11.57,52.46) ; v1(17.78,29.21) 16.38,30.61 12.96,30.61 v1(12.33,31.25) 12.33,35.57 13.24,36.48 U1.60 ; 19.52,28.47 v1(19.52,29.22) ; U21.27 4.75,28.84 6.99,28.84 7.5,28.33 9.03,28.33 9.66,28.96 v1(9.66,29.85)
  Bottom Layer w0.203: v1(17.78,29.21) 19.51,29.21 v1(19.52,29.22) ; v1(11.57,52.46) 11.57,41.41 9.66,39.5 v1(9.66,29.85) 9.69,29.83 9.69,29.02 10.12,28.58 11.18,28.58 11.69,29.09 11.69,30.61 v1(12.33,31.25)
NRST: length 86.1
  Top Layer w0.203: v1(33.92,33.41) 26.87,33.41 24.9,35.38 24.9,41.16 23.78,42.28 U1.38 23.78,44.61 25.05,45.88 27.77,45.88 30,48.11 30,52.6 30.62,53.22 30.62,56.52 30.11,57.03 v1(29.47,57.03) ; R24.1 18.39,68.42 RESET.1 RESET.2 26.59,68.42 C33.2 27.69,67.32 33.79,67.32 34.43,66.68 34.43,59.82 v1(32.9,58.3) ; U22.35 36.33,20.12 v1(36.33,20.84) 35.24,21.93 35.24,25.36 33.79,26.8
  Bottom Layer w0.203: v1(29.47,57.03) 30.74,58.3 v1(32.9,58.3) ; 33.79,26.8 v1(33.92,26.8) 34.4,27.29 34.4,32.93 v1(33.92,33.41)
PA0: length 53.2
  Top Layer w0.203: R21.1 v1(25.41,53.22) ; v1(25.41,58.81) 30.67,58.81 31.76,57.72 31.76,52.71 31.12,52.08 31.12,47.76 28.33,44.97 26.55,44.97 26.28,44.69 U1.33
  Bottom Layer w0.203: U21.3 4.75,59.32 24.9,59.32 v1(25.41,58.81) v1(25.41,53.22)
PA1: length 51.5
  Top Layer w0.203: v1(23.63,58.1) 30.57,58.1 31.38,57.3 31.38,52.87 30.7,52.2 30.7,47.85 28.13,45.27 26.22,45.27 25.78,44.83 U1.34 ; R20.1 v1(23.63,53.22)
  Bottom Layer w0.203: U21.5 4.64,56.67 6.5,56.67 6.53,56.65 23.55,56.65 23.63,56.57 ; v1(23.63,58.1) 23.63,56.57 ; 23.63,56.57 v1(23.63,53.22)
PA2/ROSC: length 43.9
  Top Layer w0.203: U22.19 36.85,37.74 v1(34.93,35.82) ; v1(27.01,50.05) 27.01,50.55 R18.1 ; U1.42 v1(21.78,42.17) ; v1(36.58,50.3) 36.58,41.54 v1(34.93,39.89)
  Bottom Layer w0.203: 27.01,48.51 27.01,45.68 23.5,42.17 v1(21.78,42.17) ; 27.01,48.51 34.8,48.51 v1(36.58,50.3) ; 27.01,48.51 v1(27.01,50.05) ; v1(34.93,35.82) v1(34.93,39.89)
PA3_LFXIN: length 8.4
  Top Layer w0.203: X3.1 24.65,48.91 24.21,48.47 C36.2 23.88,47.25 22.36,45.73 21.85,45.73 21.28,45.16 U1.43
PA4_LFXOUT: length 7.8
  Top Layer w0.203: U1.44 20.78,45.09 21.8,46.11 22.11,46.11 22.79,46.8 C37.2 22.79,48.47 22.1,49.16 X3.2
PA5_HFXIN: length 8.5
  Top Layer w0.203: U1.45 20.28,45.01 19.44,45.85 19.44,47.2 C34.1 18.55,48.09 18.55,50.05 X1.1
PA6_HFXOUT: length 6.6
  Top Layer w0.203: X1.3 17.97,48.93 C35.2 17.97,46.69 19.78,44.88 U1.46
PA7: length 68.8
  Top Layer w0.203: v1(15.25,41.92) 15.32,41.98 U1.49 ; v1(29.47,51.32) 28.35,52.43 21.5,52.43 20.89,53.04 15.96,53.04 15.25,52.33 15.25,46.49 v1(16.52,45.22) ; U22.32 40.32,23.76 38.24,23.76 37.22,24.77 37.22,27.44 35.31,29.34 30.49,29.34 v1(28.96,30.87) ; v1(29.47,42.73) 29.47,45.6 31.63,47.76 v1(31.63,49.66)
  Bottom Layer w0.203: v1(28.96,30.87) 29.47,31.38 v1(29.47,42.73) ; v1(15.25,41.92) 16.52,43.19 v1(16.52,45.22) ; v1(31.63,49.66) 29.98,51.32 v1(29.47,51.32)
PA8: length 23.7
  Top Layer w0.203: v1(7.5,49.79) 10.3,49.79 12.45,47.63 12.45,41.28 14.25,39.48 U1.54
  Bottom Layer w0.203: v1(7.5,49.79) 7.5,51.32 7.12,51.7 4.77,51.7 3.49,52.98
PA9: length 21.7
  Top Layer w0.203: U21.9 4.77,49.16 9.66,49.16 11.95,46.87 11.95,41.03 13.99,38.98 U1.55
PA12: length 27.8
  Top Layer w0.203: U1.5 20.78,34.56 v1(21.28,35.06)
  Bottom Layer w0.203: U21.29 4.75,26.3 6.4,26.3 7.79,24.9 11.69,24.9 14.74,27.95 14.74,29.98 15.68,30.92 18.73,30.92 20.69,32.88 20.69,34.47 v1(21.28,35.06)
PA13: length 23.5
  Top Layer w0.203: U1.6 v1(21.28,34.3)
  Bottom Layer w0.203: U21.30 6.8,24.26 11.77,24.26 15.25,27.74 15.25,29.85 16.01,30.61 19.19,30.61 21.28,32.71 v1(21.28,34.3)
PA14: length 27.8
  Top Layer w0.203: U1.7 21.78,38.54 v1(24.27,41.03)
  Bottom Layer w0.203: 39.04,47.9 37.61,47.9 35.34,45.63 33.38,45.63 32.39,46.62 29.85,46.62 v1(24.27,41.03)
PA15: length 29.5
  Top Layer w0.203: U1.8 22.28,38.15 v1(24.27,40.14)
  Bottom Layer w0.203: v1(24.27,40.14) 30.11,45.98 32.39,45.98 33.28,45.09 35.95,45.09 37.37,46.51 40.19,46.51 41.58,47.9
PA16: length 25.2
  Top Layer w0.203: U1.9 22.78,37.83 v1(24.27,39.31)
  Bottom Layer w0.203: v1(24.27,39.31) 30.31,45.36 32.38,45.36 33.16,44.58 36.58,44.58 37.36,45.36 U22.13
PA17: length 27
  Top Layer w0.203: v1(24.33,38.42) 23.28,37.38 U1.10
  Bottom Layer w0.203: v1(24.33,38.42) 24.33,38.69 30.32,44.69 32.34,44.69 32.95,44.08 40.3,44.08 U22.14
PA18/BSL: length 96.9
  Top Layer w0.203: v1(32.77,43.57) 33.31,44.1 33.31,46.31 33.92,46.92 33.92,56.78 35.57,58.43 35.57,68.08 34.43,69.22 17.66,69.22 16.85,68.42 BSL.1 9.75,68.42 R25.2 ; U1.11 23.78,31.48 24.27,31 25.28,31 25.59,30.69 27.22,30.69 28.31,31.78 33.79,31.78 ; U22.36 40.32,18.68 38.36,18.68 37.09,19.95 v1(37.09,20.84) ; 33.79,27.69 35.72,25.76 v1(35.72,23.38)
  Bottom Layer w0.203: v1(32.77,43.57) 32.77,38.49 33.44,37.83 33.44,32.27 v1(33.92,31.78) v1(33.92,27.69) ; v1(37.09,20.84) 36.22,21.71 35.33,21.71 34.93,22.11 34.93,22.59 v1(35.72,23.38)
PA19/SWDIO: length 54.5
  Top Layer w0.203: v1(10.68,29.85) 10.68,28.57 8.01,25.9 8.01,16.01 8.77,15.25 12.45,15.25 13.2,14.5 U20.6 ; v1(24.27,34.3) 24.28,34.28 U1.12 ; U21.19 4.77,36.46 8.39,36.46 8.9,35.95 8.9,33.54 v1(10.68,31.76)
  Bottom Layer w0.203: v1(10.68,29.85) v1(10.68,31.76) 11.67,32.75 15.81,32.75 18.76,35.69 22.87,35.69 v1(24.27,34.3)
PA20/SWCLK: length 54.4
  Top Layer w0.203: v1(10.68,32.65) 9.53,33.79 9.53,36.96 8.76,37.74 U21.20 ; v1(24.27,35.06) 24.78,34.54 U1.13 v1(24.78,31.5) ; v1(17.66,20.21) 17.21,19.76 16.46,19.76 15.74,19.04 U20.4
  Bottom Layer w0.203: v1(17.66,20.21) 17.03,20.84 17.03,25.84 17.61,26.42 20.07,26.42 24.78,31.13 v1(24.78,31.5) ; v1(24.27,35.06) 23.12,36.2 18.17,36.2 15.02,33.05 11.08,33.05 v1(10.68,32.65)
PA21/VREF-: length 64.7
  Top Layer w0.203: C44.1 13.22,27.95 15.25,27.95 15.83,27.36 15.83,25.08 16.39,24.52 17.03,24.52 17.53,24.01 v1(20.46,24.01) ; v1(37.09,32.14) 36.2,31.25 33.26,31.25 33.05,31.45 28.66,31.45 v1(28.08,30.87) ; R4.1 v1(21.6,22.35) ; U1.17 32.83,34.48 37.35,39 40.3,39 U22.18
  Bottom Layer w0.203: v1(37.09,32.14) 37.6,32.65 37.6,38.11 38.36,38.87 38.54,38.87 38.56,38.89 39.51,38.89 39.53,38.87 40.17,38.87 U22.18 ; 21.6,24.01 27.31,24.01 28.08,24.77 v1(28.08,30.87) ; 21.6,24.01 v1(20.46,24.01) ; 21.6,24.01 v1(21.6,22.35)
PA22: length 24.8
  Top Layer w0.203: U1.18 32.57,34.98 37.88,40.29 37.88,48.68 38.36,49.16 40.3,49.16 U22.10
PA23/VREF+: length 55.4
  Top Layer w0.203: v1(33.54,38.62) 32.91,37.98 U1.24 ; v1(34.55,24.14) 34.27,23.86 28.05,23.86 27.69,23.5 21.22,23.5 20.84,23.12 17.53,23.12 16.9,23.76 15.42,23.76 14.49,24.69 R6.1 C44.2 10.94,25.67 TP4.1 9.41,24.14 9.41,21.05 9.61,20.84 R5.1 R7.1
  Bottom Layer w0.203: v1(33.54,38.62) 34.43,37.73 34.43,34.3 35.39,33.33 35.39,24.98 v1(34.55,24.14)
PA24: length 27
  Top Layer w0.203: v1(37.09,50.93) 36.54,50.93 36.08,50.47 36.08,41.92 32.64,38.48 U1.25
  Bottom Layer w0.203: U22.6 40.3,54.24 37.98,54.24 37.09,53.35 v1(37.09,50.93)
PA25: length 26.6
  Top Layer w0.203: U22.5 40.39,54.16 40.39,52.2 39.89,51.7 36.46,51.7 35.7,50.93 35.7,42.43 32.25,38.98 U1.26
PA26: length 27
  Top Layer w0.203: U22.4 40.3,56.78 37.35,56.78 34.81,54.24 34.81,43.31 32.48,40.98 U1.30
PA27: length 24.9
  Top Layer w0.203: U1.31 32.21,41.48 34.3,43.57 34.3,55.63 36.72,58.06 U22.3
PA28: length 42.1
  Top Layer w0.203: U1.35 25.28,44.96 25.89,45.57 27.92,45.57 30.36,48.01 30.36,52.46 31,53.09 31,56.81 30.29,57.52 v1(18.3,57.52)
  Bottom Layer w0.203: U21.4 6.56,57.52 v1(18.3,57.52)
PA29: length 38.6
  Top Layer w0.203: U1.36 24.78,42.55 25.73,41.6 v1(25.73,37.54)
  Bottom Layer w0.203: U21.34 6.4,20.33 10.04,20.33 16.54,26.83 16.54,29.29 16.95,29.7 20.81,29.7 24.01,32.9 25.54,32.9 26.81,34.17 26.81,36.46 v1(25.73,37.54)
PA30: length 29.7
  Top Layer w0.203: U1.37 24.28,42.41 25.21,41.49 25.21,35.53 26.82,33.92 34.17,33.92 v1(34.93,34.68)
  Bottom Layer w0.203: U22.27 36.45,27.58 35.95,28.07 35.95,33.66 v1(34.93,34.68)
PA31: length 32.2
  Top Layer w0.203: v1(13.6,56.02) 14.49,55.14 14.49,43.82 15.64,42.67 17.8,42.67 19.06,41.41 22.74,41.41 23.25,41.92 23.25,43.75 U1.39
  Bottom Layer w0.203: v1(13.6,56.02) 7.89,56.02 7.38,55.52 U21.6
PB0/SPI1_CS2: length 64.1
  Top Layer w0.203: v1(17.79,45.22) 17.28,45.22 15.76,46.74 15.76,51.95 16.54,52.74 20.76,52.74 21.37,52.13 27.77,52.13 v1(28.58,51.32) ; v1(29.85,30.87) 31.07,29.65 35.9,29.65 37.58,27.97 37.58,26.5 U22.29 ; U1.47 v1(19.28,42.17) ; v1(31.63,50.68) 32.11,50.2 32.11,47.73 29.98,45.6 v1(29.98,43.31)
  Bottom Layer w0.203: v1(29.85,30.87) 30.01,31.02 30.01,43.29 v1(29.98,43.31) ; v1(28.58,51.32) 29.09,51.82 30.49,51.82 v1(31.63,50.68) ; v1(17.79,45.22) 17.79,43.66 v1(19.28,42.17)
PB1/SPI1_CS3: length 66.4
  Top Layer w0.203: U1.48 16.05,43.78 14.87,44.97 14.87,52.84 15.38,53.35 21.04,53.35 21.65,52.74 28.56,52.74 28.96,52.33 v1(29.47,52.33) ; U22.30 40.32,26.3 38.49,26.3 37.88,26.9 37.88,28.43 36.33,29.98 31.63,29.98 v1(30.74,30.87) ; v1(30.49,42.73) 30.49,43.57 30.29,43.77 30.29,45.4 32.42,47.53 32.42,51.04 v1(31.63,51.82)
  Bottom Layer w0.203: v1(29.47,52.33) 31.12,52.33 v1(31.63,51.82) ; v1(30.74,30.87) 30.49,31.12 v1(30.49,42.73)
PB2: length 35.8
  Top Layer w0.203: U1.50 16.93,41.43 14.97,41.43 14.11,42.3 14.11,54.28 13.65,54.74 v1(13.6,54.74)
  Bottom Layer w0.203: U21.15 4.75,44.08 6.47,44.08 8.01,45.61 8.01,53.86 8.9,54.74 v1(13.6,54.74)
PB3: length 37.4
  Top Layer w0.203: v1(13.6,54.11) 13.6,42.17 14.78,40.98 U1.51
  Bottom Layer w0.203: U21.17 4.75,41.54 6.63,41.54 8.52,43.43 8.52,53.22 9.41,54.11 v1(13.6,54.11)
PB4: length 20.6
  Top Layer w0.203: U1.52 14.52,40.48 13.22,41.79 13.22,49.41 11.05,51.58 7.42,51.58 6.03,52.98
PB5: length 19.4
  Top Layer w0.203: U1.53 14.39,39.98 12.84,41.54 12.84,48.52 10.92,50.44 U21.10
PB6: length 42.6
  Top Layer w0.203: U1.58 12.47,37.48 11.31,36.33 11.31,31.27 ; 11.31,31.27 4.64,31.27 3.49,30.12 ; 11.31,31.27 11.31,30.74 12.45,29.6 15.84,29.6 16.85,28.58 17.2,28.58 17.64,28.15 v1(17.64,27.85) ; v1(24.14,28.2) 20.96,28.2 v1(20.58,28.58) ; v1(27.44,25.15) 26.95,24.66 25.55,24.66
  Bottom Layer w0.203: v1(20.58,28.58) 19.85,27.85 v1(17.64,27.85) ; v1(27.44,25.15) 27.44,25.53 26.81,26.17 26.81,27.95 26.55,28.2 v1(24.14,28.2)
PB7: length 45
  Top Layer w0.203: 25.55,25.93 26.93,25.93 v1(27.44,26.44) ; v1(27.44,28.96) 27.31,29.09 20.46,29.09 v1(20.33,29.22) ; v1(17.03,29.09) 16.01,30.11 12.79,30.11 11.82,31.07 11.82,35.82 12.98,36.98 U1.59 ; v1(17.03,28.07) 16.74,28.07 15.85,28.96 12.25,28.96 10.72,30.49 6.4,30.49 6.03,30.12
  Bottom Layer w0.203: v1(27.44,28.96) v1(27.44,26.44) ; v1(20.33,29.22) 19.69,28.58 17.04,28.58 17.03,28.6 ; 17.03,28.6 v1(17.03,28.07) ; 17.03,28.6 v1(17.03,29.09)
PB12: length 18.1
  Top Layer w0.203: U21.16 8.25,42.82 9.03,42.04 9.03,39.63 10.68,37.98 v1(10.68,34.3) ; v1(14.61,34.3) 14.8,34.48 U1.64
  Bottom Layer w0.203: v1(10.68,34.3) v1(14.61,34.3)
PB13: length 18.2
  Top Layer w0.203: U1.1 18.78,33.28 14.87,33.28 v1(14.61,33.54) ; v1(10.68,33.54) 10.04,34.17 10.04,37.47 7.24,40.28 U21.18
  Bottom Layer w0.203: v1(14.61,33.54) v1(10.68,33.54)
PB15: length 28.5
  Top Layer w0.203: 3.49,47.9 4.77,46.62 9.28,46.62 10.8,45.09 10.8,40.39 v1(12.58,38.62) ; U1.3 19.78,36.75 19.31,37.22 v1(19.31,38.62)
  Bottom Layer w0.203: v1(19.31,38.62) v1(12.58,38.62)
PB16: length 27.1
  Top Layer w0.203: U21.13 4.77,44.08 9.28,44.08 9.66,43.7 9.66,39.63 v1(11.57,37.73) ; U1.4 20.28,37.27 v1(19.82,37.73)
  Bottom Layer w0.203: v1(11.57,37.73) v1(19.82,37.73)
PB17: length 26.2
  Top Layer w0.203: U1.14 25.28,31.58 25.87,31 26.93,31 28.2,32.27 34.89,32.27 35.78,33.15 v1(37.09,33.15)
  Bottom Layer w0.203: v1(37.09,33.15) 35.95,34.3 35.95,41.03 37.74,42.82 U22.15
PB18: length 25.8
  Top Layer w0.203: v1(37.09,34.68) 36.58,34.68 34.48,32.57 27.75,32.57 26.55,31.38 25.98,31.38 25.78,31.58 U1.15
  Bottom Layer w0.203: v1(37.09,34.68) 36.46,35.31 36.46,40.14 37.85,41.54 40.3,41.54 U22.16
PB19: length 17.5
  Top Layer w0.203: U1.16 26.28,32.88 26.32,32.93 34.17,32.93 37.09,35.85 v1(37.09,35.95)
  Bottom Layer w0.203: U22.17 37.09,38.33 v1(37.09,35.95)
PB20: length 21.9
  Top Layer w0.203: U1.19 32.23,35.48 37.47,40.73 37.47,48.87 U22.9
PB21: length 57
  Top Layer w0.203: KEY.1 KEY.2 34.34,68.42 34.93,67.83 34.93,59.06 32.65,56.78 32.65,52.84 33.16,52.33 33.16,47.25 31.25,45.35 v1(31.25,44.2) ; v1(32.52,30.87) 38.28,30.87 39.04,30.12 ; U1.20 32.05,35.98 v1(32.52,36.46)
  Bottom Layer w0.203: v1(31.25,44.2) 31.63,43.82 31.63,37.35 v1(32.52,36.46) v1(32.52,30.87)
PB22: length 58.8
  Top Layer w0.203: v1(21.6,18.8) 22.87,20.07 26.3,20.07 v1(26.42,20.2) ; 41.58,30.12 40.3,28.84 38.18,28.84 36.63,30.39 32.11,30.39 v1(31.63,30.87) ; U1.21 v1(31.63,36.48) ; v1(20.84,12.96) 20.84,10.16 R19.1
  Bottom Layer w0.203: 20.78,12.89 20.2,13.47 19.31,13.47 16.65,16.14 16.65,17.79 17.15,18.3 21.09,18.3 v1(21.6,18.8) ; v1(31.63,36.48) v1(31.63,30.87) 31,30.23 31,20.96 30.23,20.2 v1(26.42,20.2)
PB23: length 32.6
  Top Layer w0.203: v1(25.73,35.69) 26.28,36.25 26.28,36.57 26.7,36.98 U1.22
  Bottom Layer w0.203: v1(25.73,35.69) 25.73,34.74 24.8,33.81 23.28,33.81 19.77,30.31 16.34,30.31 15.76,29.73 15.76,27.57 11.95,23.76 4.75,23.76 U21.31
PB24: length 25.6
  Top Layer w0.203: U1.23 33.55,37.48 37.09,41.03 v1(37.09,49.79)
  Bottom Layer w0.203: v1(37.09,49.79) 37.73,50.43 37.73,51.32 38.11,51.7 40.3,51.7 41.58,52.98
PB25: length 21.9
  Top Layer w0.203: 39.04,52.98 36.21,52.98 35.19,51.95 35.19,42.81 31.87,39.48 U1.27
PB27: length 38.1
  Top Layer w0.203: U1.29 26.77,40.48 26.3,40.01 26.3,37.22 25.66,36.58
  Bottom Layer w0.203: v1(25.73,36.58) 26.3,36.01 26.3,34.42 25.28,33.41 23.63,33.41 20.23,30 16.67,30 16.14,29.47 16.14,27.31 10.04,21.22 4.75,21.22 U21.33
USB_D+: length 25.1
  Top Layer w0.254: 32.47,7.4 32.47,8.34 v1(32.77,8.64) ; 31.47,7.4 31.47,8.64 ; 31.47,8.64 31.47,8.64 v1(30.87,8.64) ; 31.47,8.64 31.47,10.96 31.18,11.25 D1.1 D1.6 27.25,11.25 26.05,12.44 26.05,13.72 25.67,14.1 20.46,14.1 19.59,14.97 19.59,16.01 19.32,16.28 U18.1
  Bottom Layer w0.254: v1(30.87,8.64) 30.87,9.01 31.17,9.31 32.47,9.31 32.77,9 v1(32.77,8.64)
USB_D-: length 25.3
  Top Layer w0.254: U18.2 19.56,16.78 19.95,16.39 19.95,15.12 20.6,14.46 21.05,14.46 21.35,14.76 21.82,14.76 22.12,14.46 22.58,14.46 22.88,14.76 23.34,14.76 23.64,14.46 24.1,14.46 24.4,14.76 24.86,14.76 25.16,14.46 25.81,14.46 26.41,13.87 26.41,13.23 26.68,12.96 27.43,12.96 D1.4 D1.3 31.05,13.15 31.25,12.95 31.25,11.69 31.97,10.97 31.97,6.5 31.76,6.29 31.22,6.29 30.97,6.54 30.97,7.4
$1N2429: length 5.9
  Top Layer w0.381: 29.47,55.87 27.44,55.87 27.19,55.62 R21.2 R20.2
$1N2474: length 16.4
  Top Layer w0.203: U1.32 31.95,41.98 33.79,43.82 v1(33.79,46.11) ; v1(28.46,47.91) 29.24,47.91 29.47,48.14 C40.1
  Bottom Layer w0.203: v1(33.79,46.11) 31.99,47.91 v1(28.46,47.91)
$1N21375: length 2
  Top Layer w0.203: R19.2 LINK1.2
$2N936: length 8.4
  Top Layer w0.203: 30.47,7.4 30.47,8.36 28.92,9.91 25.41,9.91 24.9,10.42 R28.1
$2N937: length 15.3
  Top Layer w0.203: R27.1 22.61,10.42 23.5,9.53 28.58,9.53 v1(28.84,9.28) ; 33.47,7.4 33.47,6.55 33.16,6.23 v1(32.77,6.23)
  Bottom Layer w0.203: v1(32.77,6.23) 30.62,6.23 29.98,6.87 29.98,8.14 v1(28.84,9.28)
$2N949: length 10.3
  Top Layer w0.203: U9.5 v1(34.49,15.12) ; R15.2 R14.1 34.56,20.84 v1(35.57,20.84)
  Bottom Layer w0.203: v1(35.57,20.84) 35.57,16.2 v1(34.49,15.12)
$2N956: length 2
  Top Layer w0.203: PWR1.2 24.9,4.87 R29.2
$2N2563: length 19.2
  Top Layer w0.203: v1(17.66,21.72) 17.03,22.35 C11.2 C10.2 R7.2 ; v1(17.54,25.48) 17.54,27.06 17.47,27.12 L2.2 16.52,27.82 15.88,28.46 11.82,28.46 TP2.1
  Bottom Layer w0.203: v1(17.54,25.48) 17.54,21.85 v1(17.66,21.72)
$3N2429: length 9.9
  Top Layer w0.305: R1.2 R0.1 15.26,55.62 13.71,57.17 H8.1
$3N2430: length 10.6
  Top Layer w0.305: R3.2 R2.1 18.92,56.78 17.15,56.78 16.25,57.68 H8.2

## Copper pours and planes (outline as drawn; the poured copper is in the pictures)
3V3 on Top Layer: 31.21,21.6 33.16,21.6 33.41,21.85 33.41,22.92 31.21,22.92
3V3 on Top Layer: 20.22,17.09 19.88,16.75 19.88,15.57 20.2,15.25 31.12,15.25 31.5,15.63 31.5,16.88 31.3,17.09
+5V on Top Layer: 33.42,10.47 33.12,10.17 32.39,10.17 31.89,10.68 31.89,16.64 32.27,17.03 33.16,17.03 33.42,16.76
GND on Top Layer: 24.65,19.82 23.88,19.06 23.88,17.75 24.36,17.28 28.2,17.28 28.46,17.53 28.46,18.93 28.71,19.18 32.77,19.18 33.03,18.93 33.03,17.28 33.41,16.9 33.41,12.33 33.66,12.07 35.44,12.07 35.7,11.82 35.7,8.77 34.92,8 34.92,5.99 35.36,5.55 36.58,5.55 37.09,6.06 37.09,18.68 35.95,19.82
GND on Top Layer: -2.99,73.01 47.01,73.01 47.01,-1.99 -2.99,-1.99
GND on Bottom Layer: -1.99,72.01 47.01,72.01 47.01,-2.99 -1.99,-2.99
VBUS_5V on Top Layer: 35.31,11.95 33.92,11.95 33.54,11.56 33.54,6.87 33.79,6.61 34.43,6.61 34.55,6.74 34.55,7.88 35.57,8.9 35.57,11.69
$2N948 on Top Layer: 33.03,17.76 33.03,18.81 32.77,19.07 28.87,19.07 28.73,18.92 28.73,17.66 28.86,17.53 32.8,17.53

## Text on the board
Bottom Solder Mask Layer: [V1.0.2]
Bottom Silkscreen Layer: AGND | GND | 5V | RX | TX | CHIP | B23 | DIO | A01 | B27 | B03 | B15 | B08 | B02 | B16 | B06 | A12 | A00 | A09 | A08 | B07 | B05 | B04 | A31 | CLK | A29 | B09 | 3V3 | B26 | B13 | B12 | A28 | A13 | A10 | A11 | B21 | RST | B10 | B11 | B17 | B25 | B20 | B19 | B00 | A27 | A25 | A02 | A14 | A30 | A16 | B01 | A21 | B14 | B22 | B24 | A17 | B18 | A07 | A23 | A15 | A22 | A24 | A26 | A18 | 以培养中国工程师为己任 | 不靠卖板赚钱 | PA0/1上拉电压 | R0 | R2 | R1 | R3 | √ | x | R4 | R8 | R5 | R9 | R6 | R7 | PIN | NULL | VDDA | INPUT | VOL | +5V | P1电压 | P2电压 | 参考电压选择 | 表示特殊引脚非必要勿使用
Top Silkscreen Layer: B22 | PWR | P1 | P2 | SCL | SDA | RES | DC | CS | BLK | GND | DIO | CLK | 3V3 | MSPM0G3507 | 立创开发板 | BSL | RST | B21 | 立  创      天  猛  星
